# Altium project IR_blaster.PrjPcb
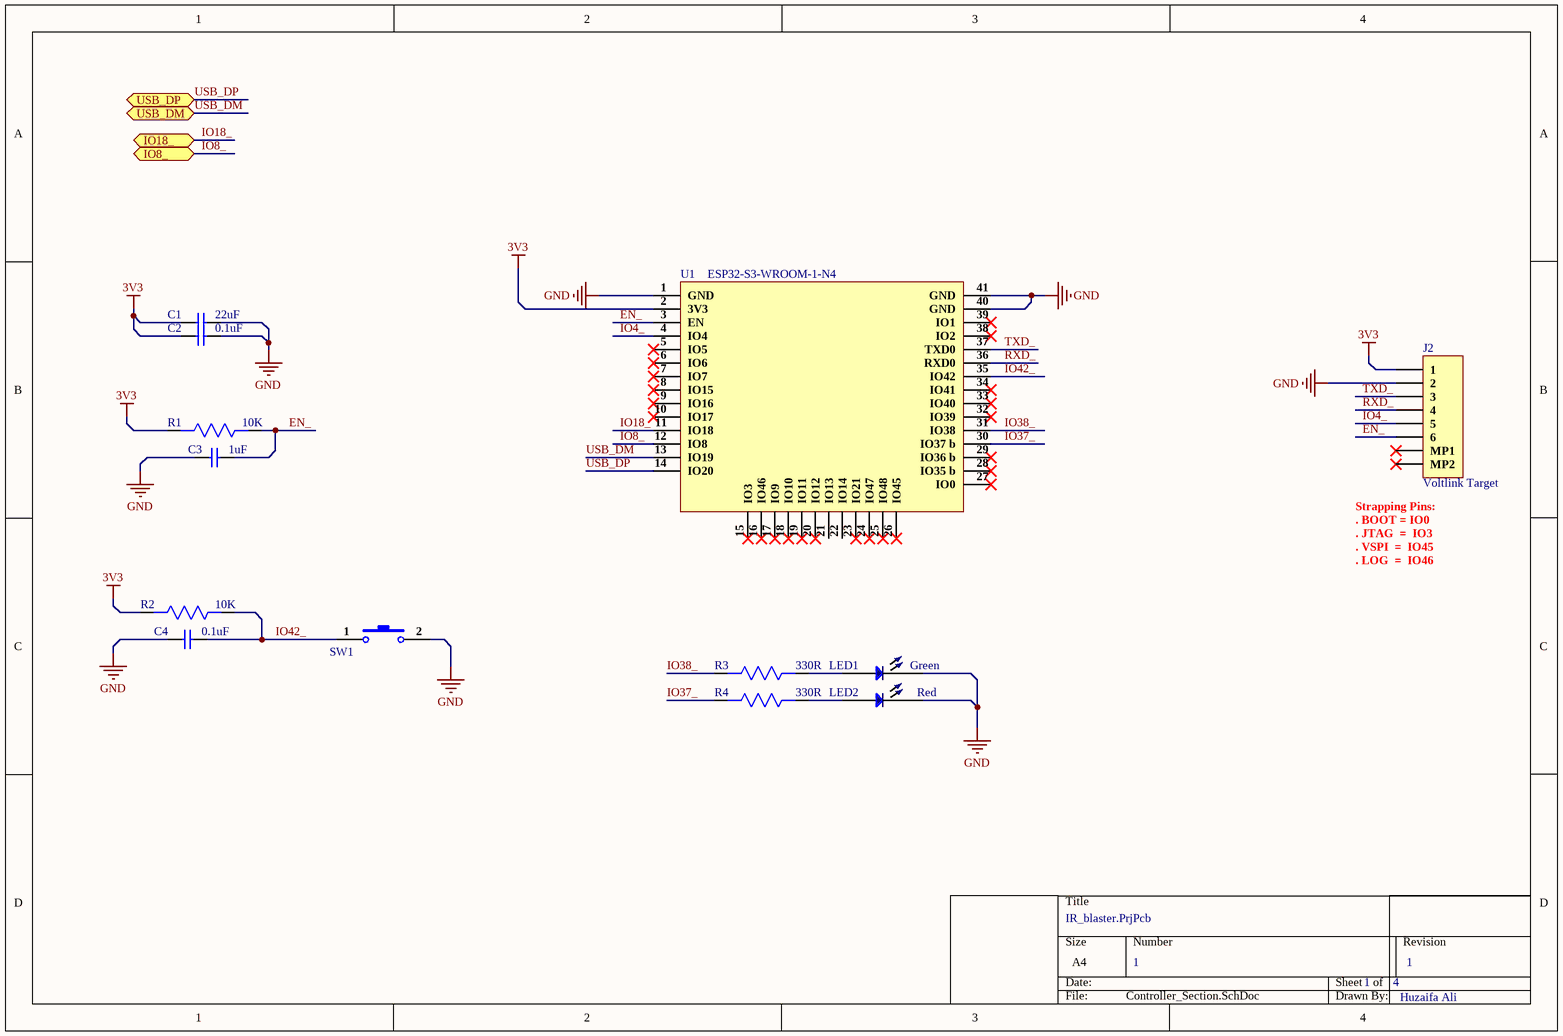
[diagram p0: Controller_Section.SchDoc]
4 sheets, 49 parts. Net scope: flat (ports and power ports of the same name join across sheets).
Board file: iR-Blaster.PcbDoc
Sheets:
  Controller_Section.SchDoc
  iR-Blaster_Section.SchDoc
  iR_Receiver_Section.SchDoc
  USB & LDO_Section.SchDoc

## Sheet Controller_Section.SchDoc: =Projectname
size A4; SheetNumber: 1; SheetTotal: 4

### Parts
C1  22uF  [Cap-0805]
C2  0.1uF  [Cap-0402]
C3  1uF  [Cap-0603]
C4  0.1uF  [Cap-0402]
J2  Voltlink Target  [Voltlink Target]
LED1  Green  [LED-0402]
LED2  Red  [LED-0402]
R1  10K  [RES-0603]
R2  10K  [RES-0603]
R3  330R  [Res-0603]
R4  330R  [Res-0603]
SW1  YTS-B003-2A  [YTS-B003-2A]  (value not drawn)
U1  ESP32-S3-WROOM-1-N4  [41-SMD Module]

### Ports
IO8_ (bidir), IO18_ (bidir), USB_DM (bidir), USB_DP (bidir)

### Nets
3V3: C1.1 C2.1 J2.1 R1.2 R2.2 U1.2(3V3)
GND: C1.2 C2.2 C3.1 C4.1 J2.2 LED1.2 LED2.2 SW1.2 U1.1(GND) U1.40(GND) U1.41(GND)
EN_: C3.2 J2.6 R1.1 U1.3(EN)
IO4_: J2.5 U1.4(IO4)
IO8_: U1.12(IO8) ; port IO8_
IO18_: U1.11(IO18) ; port IO18_
IO37_: R4.2 U1.30(IO37_b)
IO38_: R3.2 U1.31(IO38)
IO42_: C4.2 R2.1 SW1.1 U1.35(IO42)
RXD_: J2.4 U1.36(RXD0)
TXD_: J2.3 U1.37(TXD0)
USB_DM: U1.13(IO19) ; port USB_DM
USB_DP: U1.14(IO20) ; port USB_DP
NetLED1_1: LED1.1 R3.1
NetLED2_1: LED2.1 R4.1

Not connected (* = marked no-connect by the designer): J2 MP1* MP2*; U1 5(IO5)* 6(IO6)* 7(IO7)* 8(IO15)* 9(IO16)* 10(IO17)* 15(IO3)* 16(IO46)* 17(IO9)* 18(IO10)* 19(IO11)* 20(IO12)* 21(IO13) 22(IO14) 23(IO21)* 24(IO47)* 25(IO48)* 26(IO45)* 27(IO0)* 28(IO35_b)* 29(IO36_b)* 32(IO39)* 33(IO40)* 34(IO41)* 38(IO2)* 39(IO1)*

### Notes on the sheet
- (near J2) Strapping Pins:
  . BOOT = IO0
  . JTAG  =  IO3
  . VSPI  =  IO45
  . LOG  =  IO46
- 1
- Huzaifa Ali

### Library data of the parts
C1 = CL21A226MAYNNNE: CAP CER 22UF 25V X5R 0805; Manufacturer: Samsung; Supplier 1: Mouser; Manufacturer Part Number: CL21A226MAYNNNE; RoHS: Yes; Category: Ceramic Capacitors; Stock 1: 1240410; Pricing 1: 1=0.28000, 10=0.18500, 50=0.18500, 100=0.10600, 500=0.07500, 1000=0.06400, 2000=0.06100, 10000=0.05400, 24000=0.05100, 50000=0.04600 (USD); RoHS Compliant: Yes; Supplier Part Number 1: 187-CL21A226MAYNNNE; LCSC Part Number: C602037
C2 C4 = C1005X5R1H104K050BB: CAP CER 0.1UF 50V X5R 0402; Manufacturer: TDK; Dielectric Material: Ceramic; Capacitance: 100nF; Tolerance: 10%; Supplier 1: Digi-Key; Manufacturer Part Number: C1005X5R1H104K050BB; Stock 1: 1455182; Pricing 1: 1=0.12, 10=0.09, 50=0.049, 100=0.04, 500=0.02858, 1000=0.02245, 2500=0.02041, 5000=0.01878 (USD); Mount: Surface Mount; Case/Package: 0402; Case Code (Metric): 1005; Case Code (Imperial): 0402; Weight: 2.3E-05oz; Min Operating Temperature: -55°C; Max Operating Temperature: 85°C; Dielectric: X5R; Voltage Rating: 50V; Packaging: Tape and Reel; Voltage Rating (DC): 50V; Termination: SMD/SMT; Construction: Flat; Package Quantity: 1; Resistor Type: Ceramic; Voltage: 50V; Series: C; Length: 1mm; Width: 0.02inch; Height: 0.5mm; Depth: 0.5mm; Thickness: 0.022inch; Radiation Hardening: No; Lead Free: Lead Free; REACH SVHC: No SVHC; RoHS Compliant: Yes; ComponentLink1URL: https://product.tdk.com/info/en/catalog/spec/mlccspec_commercial_general_midvoltage_en.pdf?src-supplier=Digi-Key; ComponentLink1Description: https://product.tdk.com/info/en/catalog/spec/mlccspec_commercial_general_midvoltage_en.pdf?src-supplier=Digi-Key; ComponentLink2URL: http://www.tdk.co.jp/tefe02/e413_c.pdf?src-supplier=Future+Electronics; ComponentLink2Description: http://www.tdk.co.jp/tefe02/e413_c.pdf?src-supplier=Future+Electronics; ComponentLink3URL: https://www.verical.com/server-webapp/html/getDatasheet?partID=743571&src-supplier=Verical; ComponentLink3Description: https://www.verical.com/server-webapp/html/getDatasheet?partID=743571&src-supplier=Verical; ComponentLink4URL: http://www.tdk.co.jp/tefe02/e412_c.pdf?src-supplier=Avnet+Europe; ComponentLink4Description: http://www.tdk.co.jp/tefe02/e412_c.pdf?src-supplier=Avnet+Europe; Supplier Part Number 1: 445-5942-1-ND; LCSC Part Number: C2181865
C3 = CC0603KRX5R8BB105: CAP CER 1UF 25V X5R 0603; Manufacturer: Yageo; Tolerance: 10%; Supplier 1: Digi-Key; Manufacturer Part Number: CC0603KRX5R8BB105; RoHS: Yes; Category: Ceramic Capacitors; Stock 1: 919939; Pricing 1: 1=0.12000, 10=0.08400, 50=0.04760, 100=0.03940, 500=0.02764, 1000=0.02288 (USD); Mount: Surface Mount; Case/Package: 0603; Number of Pins: 2; Case Code (Metric): 1608; Case Code (Imperial): 0603; Min Operating Temperature: -55°C; Max Operating Temperature: 85°C; Capacitance: 1uF; Dielectric: X5R; Package Quantity: 1; Voltage Rating: 25V; Packaging: Tape and Reel; Termination: SMD/SMT; Voltage Rating (DC): 25V; Series: CC; Construction: Flat; Length: 1.6mm; Width: 0.031inch; Height: 0.8mm; Thickness: 0.035inch; Depth: 0.8mm; Radiation Hardening: No; REACH SVHC: No SVHC; Lead Free: Lead Free; Halogen Free: Halogen Free; RoHS Compliant: Yes; ComponentLink1URL: https://datasheet.ciiva.com/176/mlccorderingcode-176785.pdf?src-supplier=Digi-Key; ComponentLink1Description: https://datasheet.ciiva.com/176/mlccorderingcode-176785.pdf?src-supplier=Digi-Key; ComponentLink2URL: https://datasheet.ciiva.com/176/mlccorderingcode-176786.pdf?src-supplier=Digi-Key; ComponentLink2Description: https://datasheet.ciiva.com/176/mlccorderingcode-176786.pdf?src-supplier=Digi-Key; ComponentLink3URL: https://datasheet.ciiva.com/176/mlccorderingcode-176787.pdf?src-supplier=Digi-Key; ComponentLink3Description: https://datasheet.ciiva.com/176/mlccorderingcode-176787.pdf?src-supplier=Digi-Key; ComponentLink4URL: https://datasheet.ciiva.com/17436/upy-gphc-x5r-4v-to-50v-12-17436952.pdf?src-supplier=Avnet+Europe; ComponentLink4Description: https://datasheet.ciiva.com/17436/upy-gphc-x5r-4v-to-50v-12-17436952.pdf?src-supplier=Avnet+Europe; ComponentLink5URL: https://datasheet.ciiva.com/7978/1525783-7978171.pdf?src-supplier=Element14; ComponentLink5Description: https://datasheet.ciiva.com/7978/1525783-7978171.pdf?src-supplier=Element14; ComponentLink6URL: https://datasheet.ciiva.com/11586/upy-gphc-x5r-4v-to-50v-12-11586318.pdf?src-supplier=Avnet; ComponentLink6Description: https://datasheet.ciiva.com/11586/upy-gphc-x5r-4v-to-50v-12-11586318.pdf?src-supplier=Avnet; Supplier Part Number 1: 311-1445-1-ND; LCSC Part Number: C14664
J2 = Voltlink Target: DNP
LED1 = 16-213/GHC-YR1S1/3T: Green 520~535nm 0402 Light Emitting Diodes (LED) RoHS; Manufacturer: Everlight Elec; Luminous Intensity (IF=20mA): 112~285mcd; Package: 0402; Illumination Color: Green; Dominant Wavelength / Coordinate rank: 520~535nm; Mounting Type: Surface Mount; Manufacturer Part Number: 16-213/GHC-YR1S1/3T; ComponentLink1Description: LCSC; ComponentLink1URL: https://www.lcsc.com/product-detail/Light-Emitting-Diodes-LED_Everlight-Elec-16-213-GHC-YR1S1-3T_C74338.html; LCSC Part Number: C74338; Item Type: LED
LED2 = XZMDK68W-2: LED RED CLEAR CHIP SMD; Manufacturer: SunLED; Lens Color: Colorless; Luminous Intensity: 69mcd; Test Current: 20mA; Viewing Angle: 120°; Dominant Wavelength: 630nm; Forward Voltage: 1.95V; Supplier 1: Digi-Key; Manufacturer Part Number: XZMDK68W-2; Stock 1: 69539; Pricing 1: 1=0.43, 10=0.306, 100=0.136, 500=0.0952, 1000=0.0782 (USD); Mount: Surface Mount; Case/Package: 0402; Color: Red; Case Code (Metric): 1005; Case Code (Imperial): 0402; Packaging: Tape and Reel; Lens Transparency: Clear; Length: 1mm; Height: 0.6mm; Width: 0.5mm; ComponentLink1URL: http://www.sunledusa.com/products/spec/XZMDK68W-2.pdf?src-supplier=Digi-Key; ComponentLink1Description: http://www.sunledusa.com/products/spec/XZMDK68W-2.pdf?src-supplier=Digi-Key; ComponentLink2URL: https://www.sunledusa.com/products/spec/XZMDK68W-2.pdf?src-supplier=Digi-Key; ComponentLink2Description: https://www.sunledusa.com/products/spec/XZMDK68W-2.pdf?src-supplier=Digi-Key; Supplier Part Number 1: 1497-1174-6-ND; Item Type: LED
R1 R2 = CRGH0603J10K: RES SMD 10K OHM 5% 1/5W 0603; Manufacturer: TE Connectivity Holsworthy; Resistance: 10kR; Temperature Coefficient: 100ppm/°C; Power Rating: 200mW; Voltage Rating: 50V; Number of Resistors: 1; ComponentLink1URL: http://www.farnell.com/datasheets/2167052.pdf?src-supplier=Element14; ComponentLink1Description: http://www.farnell.com/datasheets/2167052.pdf?src-supplier=Element14; ComponentLink2URL: https://www.rohm.com/datasheet/ESR01MZPF/esr-e?src-supplier=Digi-Key; ComponentLink2Description: https://www.rohm.com/datasheet/ESR01MZPF/esr-e?src-supplier=Digi-Key; Supplier 1: Digi-Key; Manufacturer Part Number: CRGH0603J10K; Stock 1: 85818; Pricing 1: 1=0.1, 10=0.049, 100=0.02, 1000=0.00899, 2500=0.0078 (USD); Mount: Surface Mount; Case/Package: 0603; Case Code (Imperial): 0603; Case Code (Metric): 1608; Min Operating Temperature: -55°C; Max Operating Temperature: 125°C; Tolerance: 5%; Packaging: Tape and Reel; Resistor Type: Thick Film,Power resistor; Number of Terminations: 2; Series: CRGH; Termination: Solder; Voltage Rating (DC): 50V; Resistance Tolerance: 5%; Technology: THICK FILM; Length: 1.6mm; Width: 0.8mm; Height: 0.45mm; Depth: 0.8mm; RoHS Compliant: Yes; REACH SVHC: No SVHC; ELV: Compliant; ComponentLink3URL: http://www.farnell.com/datasheets/2007183.pdf?src-supplier=Element14; ComponentLink3Description: http://www.farnell.com/datasheets/2007183.pdf?src-supplier=Element14; Supplier Part Number 1: A126394DKR-ND; LCSC Part Number: C2092011
R3 R4 = RC0603JR-07330RL: RES  SMD 330R 100 mW 0603; Manufacturer: Yageo; Power Rating: 100mW; Tolerance: 5%; Voltage Rating (DC): 50V; Temperature Coefficient: 100ppm/°C; Supplier 1: Digi-Key; Manufacturer Part Number: RC0603JR-07330RL; RoHS: Yes; Category: Chip SMD Resistors; Stock 1: 1074593; Pricing 1: 1=0.10000, 10=0.02000, 100=0.00800, 1000=0.00360, 2500=0.00312 (USD); Case/Package: 0603; Number of Pins: 2; Case Code (Imperial): 0603; Case Code (Metric): 1608; Size Code: 0603; Min Operating Temperature: -55°C; Max Operating Temperature: 155°C; Resistance: 330R; Packaging: Tape and Reel; Voltage Rating: 50V; Package Quantity: 5000; Termination: SMD/SMT; Resistor Type: Thick Film; Features: Moisture Resistant; Series: RC; Max Power Dissipation: 100mW; Number of Terminations: 2; Resistance Tolerance: 5%; Construction: Rectangular; Length: 1.6mm; Width: 0.8mm; Height: 0.45mm; Depth: 0.8mm; REACH SVHC: No SVHC; Lead Free: Lead Free; Military Standard: Not; RoHS Compliant: Yes; Supplier Part Number 1: 311-330GRCT-ND; LCSC Part Number: C105879
SW1 = YTS-B003-2A: 3.5mm 3.5mm SMDSplicing Black Rectangle button 50mA Surface Mount 7mm SPST 100MΩ 20000 12V 250gf@±50gf SMD Tactile Switches ROHS; Manufacturer: YIYUAN; Item Type: Switch; Manufacturer Part Number: YTS-B003-2A; Package: Custom; LCSC Part Number: C2910695; ComponentLink1Description: LCSC; ComponentLink1URL: https://lcsc.com/product-detail/Tactile-Switches_YIYUAN-YTS-B003-2A_C2910695.html
U1 = ESP32-S3-WROOM-1-N4: SMD MODULE, ESP32-S3, 4 MB SPI F; Manufacturer: Espressif Systems; Supplier 1: Mouser; Manufacturer Part Number: ESP32-S3-WROOM-1-N4; RoHS: No; Category: Uncategorized; Stock 1: 2246; Pricing 1: 1=3.15000, 10=3.15000, 50=3.15000, 100=3.15000, 1000=3.15000, 10000=3.15000 (USD); Supplier Part Number 1: 356-ESP32-S3WROOM1N4; ComponentLink1Description: LCSC; ComponentLink1URL: https://lcsc.com/product-detail/WiFi-Modules_Espressif-Systems-ESP32-S3-WROOM-1-N4_C2913197.html; LCSC Part Number: C2913197; Item Type: Module

## Sheet iR-Blaster_Section.SchDoc: =Projectname
size A4; SheetNumber: 2; SheetTotal: 4
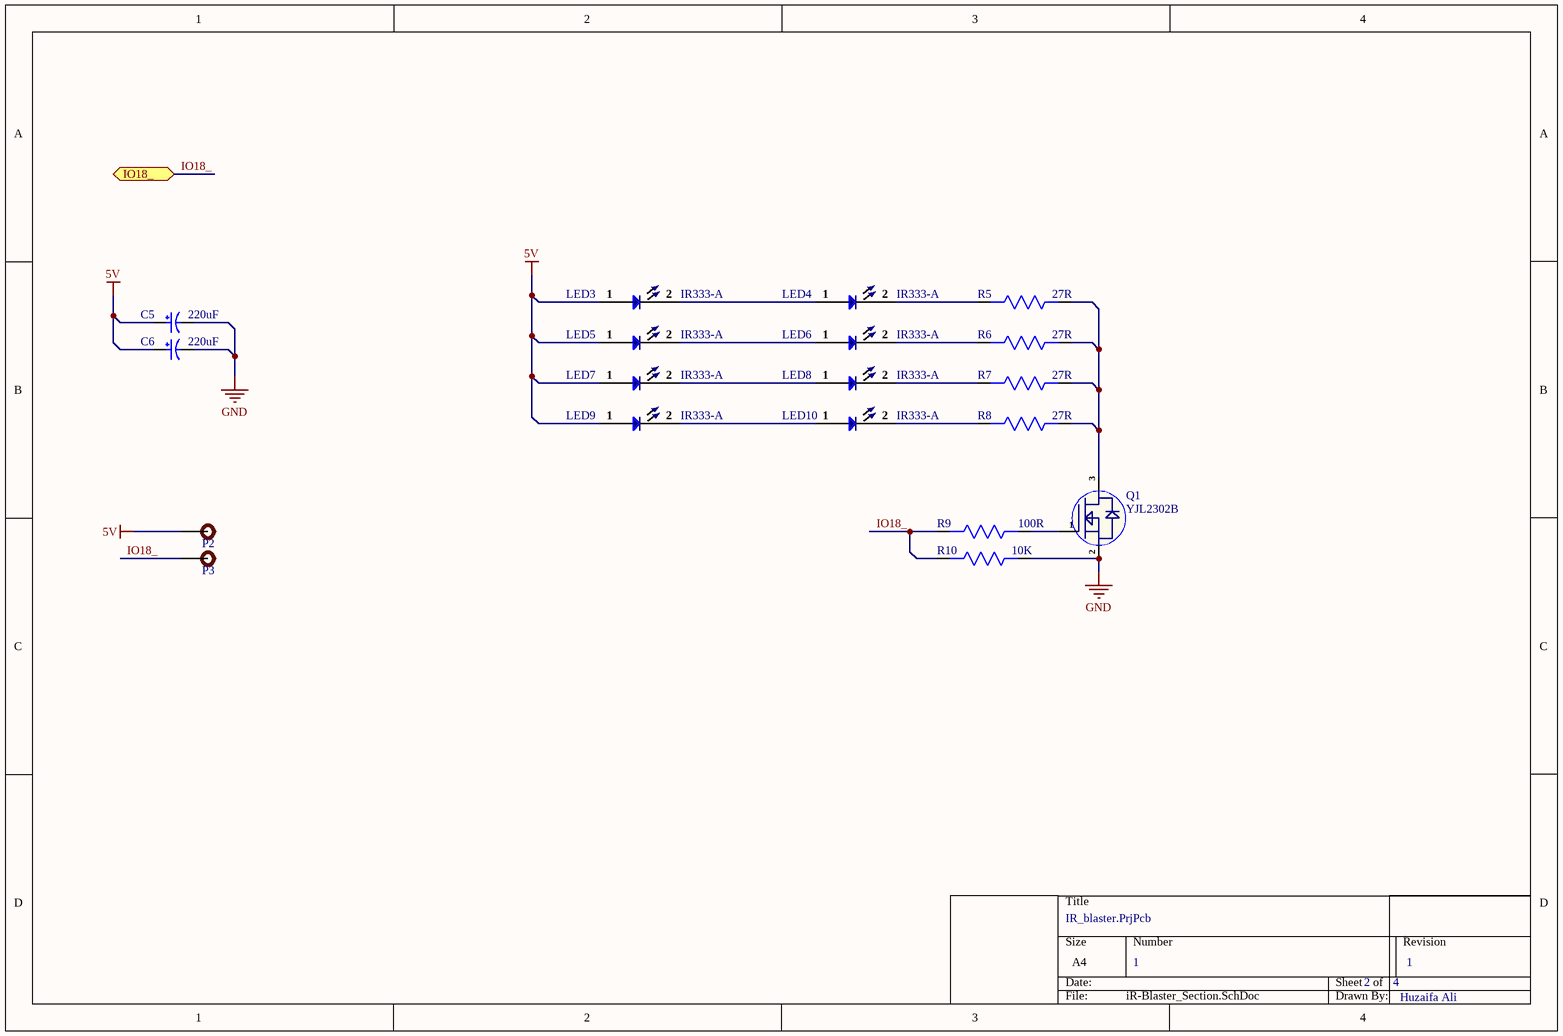
[diagram p1: iR-Blaster_Section.SchDoc]

### Parts
C5  220uF  [RT1A221M0605]
C6  220uF  [RT1A221M0605]
LED3  IR333-A  [IR333_A]
LED4  IR333-A  [IR333_A]
LED5  IR333-A  [IR333_A]
LED6  IR333-A  [IR333_A]
LED7  IR333-A  [IR333_A]
LED8  IR333-A  [IR333_A]
LED9  IR333-A  [IR333_A]
LED10  IR333-A  [IR333_A]
P2  TEST POINT  [Test-point]  (value not drawn)
P3  TEST POINT  [Test-point]  (value not drawn)
Q1  YJL2302B  [SOT-23-3L_]
R5  27R  [Res_1210]
R6  27R  [Res_1210]
R7  27R  [Res_1210]
R8  27R  [Res_1210]
R9  100R  [Res-0603]
R10  10K  [RES-0603]

### Ports
IO18_ (bidir)

### Nets
5V: C5.1 C6.1 LED3.1 LED5.1 LED7.1 LED9.1 P2.1
GND: C5.2 C6.2 Q1.2(S) R10.1
IO18_: P3.1 R9.2 R10.2 ; port IO18_
NetLED3_2: LED3.2 LED4.1
NetLED4_2: LED4.2 R5.2
NetLED5_2: LED5.2 LED6.1
NetLED6_2: LED6.2 R6.2
NetLED7_2: LED7.2 LED8.1
NetLED8_2: LED8.2 R7.2
NetLED9_2: LED9.2 LED10.1
NetLED10_2: LED10.2 R8.2
NetQ1_1: Q1.1(G) R9.1
NetQ1_3: Q1.3(D) R5.1 R6.1 R7.1 R8.1

### Notes on the sheet
- 1
- Huzaifa Ali

### Library data of the parts
C5 C6 = RT1A221M0605: 220uF 5.4mm 10V 6.3mm ±20% SMD,D6.3xL5.4mm Aluminum Electrolytic Capacitors - SMD ROHS; Manufacturer: ROQANG; Manufacturer Part Number: RT1A221M0605; Package: SMD,D6.3xL5.4mm; LCSC Part Number: C267466; Item Type: Capacitor; ComponentLink1Description: LCSC; ComponentLink1URL: https://lcsc.com/product-detail/Aluminum-Electrolytic-Capacitors-SMD_ROQANG-RT1A221M0605_C267466.html
LED3-LED10 = IR333-A: EMITTER IR 940NM 100MA RADIAL; Manufacturer: Everlight; Forward Current: 50mA; Forward Voltage: 1.2V; Viewing Angle: 20°; Lens Style: Diffused,Colored,Circular; Number of LEDs: 1; Test Current: 20mA; Power Dissipation: 100mW; Reverse Voltage: 5V; Item Type: Infrared LED; Supplier 1: Digi-Key; Manufacturer Part Number: IR333-A; RoHS: Yes; Category: LEDs; Stock 1: 73854; Pricing 1: 1=0.54000, 10=0.33000, 100=0.18950, 1000=0.14832, 2000=0.13596, 5000=0.12360, 10000=0.11536, 25000=0.11124 (USD); Mount: Through Hole; Case/Package: Radial; Number of Pins: 2; Min Operating Temperature: -40°C; Max Operating Temperature: 85°C; Packaging: Bulk; Wavelength: 940nm; Package Quantity: 500; Number of Elements: 1; Orientation: Top View; Series: -; Max Power Dissipation: 100mW; Length: 5.9mm; Depth: 5.9mm; RoHS Compliant: Yes; Lead Free: Lead Free; ComponentLink1URL: https://datasheet.ciiva.com/2107/201407061516067600-2107736.pdf?src-supplier=Digi-Key; ComponentLink1Description: https://datasheet.ciiva.com/2107/201407061516067600-2107736.pdf?src-supplier=Digi-Key; ComponentLink2URL: https://datasheet.ciiva.com/48438/ir333-a-eng-tds-48438869.pdf?src-supplier=Distrelec; ComponentLink2Description: https://datasheet.ciiva.com/48438/ir333-a-eng-tds-48438869.pdf?src-supplier=Distrelec; Supplier Part Number 1: 1080-1080-ND; LCSC Part Number: C95407
P2 P3 = TEST POINT: Test Point ON
Q1 = YJL2302B: 20V 3A 40mΩ@4.5V,3A 700mW 780mV@250uA 29pF@10V N Channel 280pF@10V 2.9nC@4.5V -55℃~+150℃@(Tj) SOT-23-3L MOSFETs ROHS; Manufacturer: Yangzhou Yangjie Elec Tech; Item Type: Mosfet; Manufacturer Part Number: YJL2302B; Package: SOT-23-3L; LCSC Part Number: C699316; ComponentLink1Description: LCSC; ComponentLink1URL: https://lcsc.com/product-detail/MOSFETs_Yangzhou-Yangjie-Elec-Tech-YJL2302B_C699316.html
R5-R8 = FRC1210F27R0TS: 500mW Thick Film Resistors 200V ±100ppm/℃ 27Ω 1210 Chip Resistor - SMD ROHS; Manufacturer: FOJAN; Manufacturer Part Number: FRC1210F27R0TS; Package: 1210; LCSC Part Number: C2960734; Item Type: Resistor; ComponentLink1Description: LCSC; ComponentLink1URL: https://www.lcsc.com/product-detail/Chip-span-style-background-color-ff0-Resistor-span-Surface-Mount_FOJAN-FRC1210F27R0TS_C2960734.html
R9 = RC0603FR-07100RL: RES SMD 100 OHM 1% 1/10W 0603; Manufacturer: Yageo; Temperature Coefficient: 100ppm/°C; Voltage Rating (DC): 50V; Power Rating: 100mW; Supplier 1: Arrow Electronics; Manufacturer Part Number: RC0603FR-07100RL; RoHS: Yes; Category: Chip SMD Resistors; Stock 1: 3800000; Pricing 1: 5000=0.00300, 5000=0.00200, 5000=0.00450, 50000=0.00410, 500000=0.00230, 2500000=0.00140 (USD); Case/Package: 0603; Number of Pins: 2; Case Code (Imperial): 0603; Case Code (Metric): 1608; Size Code: 0603; Min Operating Temperature: -55°C; Max Operating Temperature: 155°C; Resistance: 100R; Tolerance: 1%; Resistor Type: Thick Film; Packaging: Tape and Reel; Voltage Rating: 50V; Termination: SMD/SMT; Features: Moisture Resistant; Series: RC; Max Power Dissipation: 100mW; Number of Terminations: 2; Construction: Rectangular; Resistance Tolerance: 1%; Technology: THICK FILM; Length: 1.6mm; Width: 0.8mm; Height: 0.45mm; Depth: 0.8mm; REACH SVHC: Unknown; Lead Free: Lead Free; RoHS Compliant: Yes; Military Standard: Not; Supplier Part Number 1: RC0603FR-07100RL; LCSC Part Number: C105588
R10 = CRGH0603J10K: as R1 on sheet Controller_Section; ComponentLink1URL: http://www.farnell.com/datasheets/2167052.pdf?src-supplier=Element14; ComponentLink1Description: http://www.farnell.com/datasheets/2167052.pdf?src-supplier=Element14; ComponentLink2URL: https://www.rohm.com/datasheet/ESR01MZPF/esr-e?src-supplier=Digi-Key; ComponentLink2Description: https://www.rohm.com/datasheet/ESR01MZPF/esr-e?src-supplier=Digi-Key; Supplier 1: Digi-Key; Manufacturer Part Number: CRGH0603J10K; Stock 1: 85818; Pricing 1: 1=0.1, 10=0.049, 100=0.02, 1000=0.00899, 2500=0.0078 (USD); Mount: Surface Mount; Case/Package: 0603; Case Code (Imperial): 0603; Case Code (Metric): 1608; Min Operating Temperature: -55°C; Max Operating Temperature: 125°C; Tolerance: 5%; Packaging: Tape and Reel; Resistor Type: Thick Film,Power resistor; Number of Terminations: 2; Series: CRGH; Termination: Solder; Voltage Rating (DC): 50V; Resistance Tolerance: 5%; Technology: THICK FILM; Length: 1.6mm; Width: 0.8mm; Height: 0.45mm; Depth: 0.8mm; RoHS Compliant: Yes; REACH SVHC: No SVHC; ELV: Compliant; ComponentLink3URL: http://www.farnell.com/datasheets/2007183.pdf?src-supplier=Element14; ComponentLink3Description: http://www.farnell.com/datasheets/2007183.pdf?src-supplier=Element14; Supplier Part Number 1: A126394DKR-ND; LCSC Part Number: C2092011

## Sheet iR_Receiver_Section.SchDoc: =Projectname
size A4; SheetNumber: 3; SheetTotal: 4
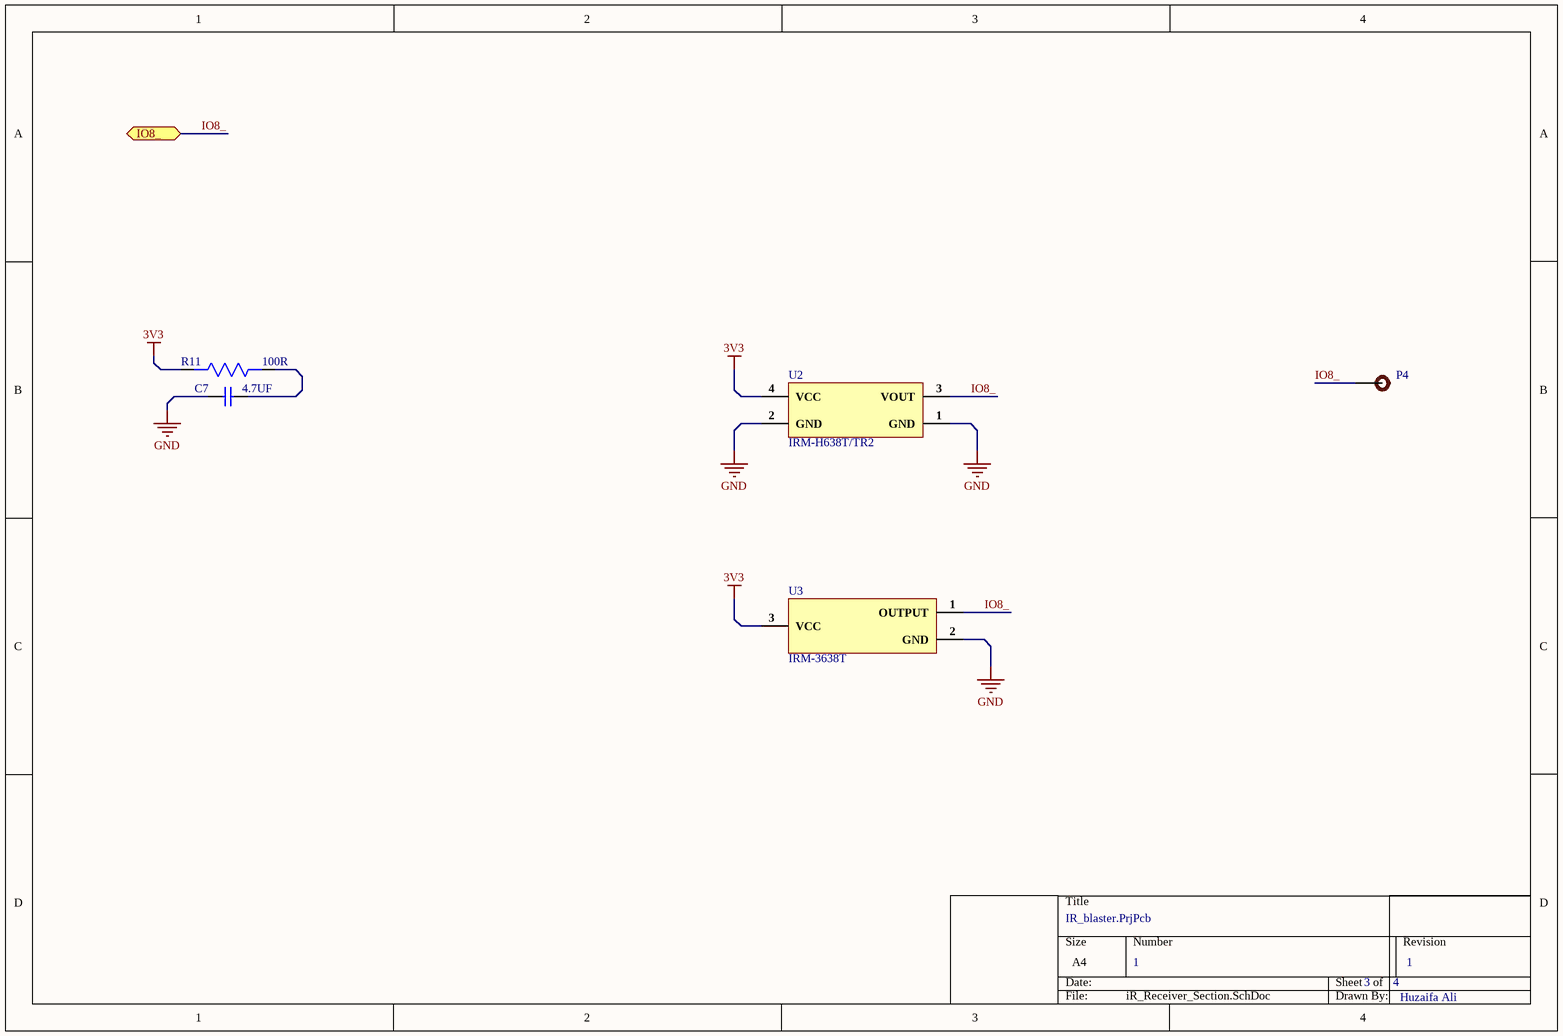
[diagram p2: iR_Receiver_Section.SchDoc]

### Parts
C7  4.7UF  [Cap-0603]
P4  TEST POINT  [Test-point]  (value not drawn)
R11  100R  [Res-0603]
U2  IRM-H638T/TR2  [SMD-4,4x5mm]
U3  IRM-3638T  [SIP-3P-2.54mm]

### Ports
IO8_ (bidir)

### Nets
3V3: R11.2 U2.4(VCC) U3.3(VCC)
GND: C7.1 U2.1(GND) U2.2(GND) U3.2(GND)
IO8_: P4.1 U2.3(VOUT) U3.1(OUTPUT) ; port IO8_
NetC7_2: C7.2 R11.1

### Notes on the sheet
- 1
- Huzaifa Ali

### Library data of the parts
C7 = CL10A475KA8NQNC: CAP CER 4.7UF 25V X5R 0603; Manufacturer: Samsung; Tolerance: 10%; Supplier 1: Digi-Key; Manufacturer Part Number: CL10A475KA8NQNC; Stock 1: 2252340; Pricing 1: 1=0.37, 10=0.255, 100=0.1528, 500=0.11456, 1000=0.09675 (USD); Mount: Surface Mount; Case/Package: 0603; Case Code (Metric): 1608; Case Code (Imperial): 0603; Contact Plating: Tin; Min Operating Temperature: -55°C; Max Operating Temperature: 85°C; Package Quantity: 1; Packaging: Tape and Reel; Capacitance: 4.7uF; Voltage Rating: 25V; Dielectric: X5R; Termination: Wraparound; Length: 1.6mm; Width: 0.031inch; Thickness: 0.035inch; Depth: 0.8mm; Lead Free: Lead Free; ComponentLink1URL: http://www.samsungsem.com/kr/support/product-search/mlcc/CL10A475KA8NQNC.jsp?src-supplier=Digi-Key; ComponentLink1Description: http://www.samsungsem.com/kr/support/product-search/mlcc/CL10A475KA8NQNC.jsp?src-supplier=Digi-Key; Supplier Part Number 1: 1276-1900-1-ND; LCSC Part Number: C69335
P4 = TEST POINT: Test Point ON
R11 = RC0603FR-07100RL: as R9 on sheet iR-Blaster_Section; Supplier 1: Arrow Electronics; Manufacturer Part Number: RC0603FR-07100RL; RoHS: Yes; Category: Chip SMD Resistors; Stock 1: 3800000; Pricing 1: 5000=0.00300, 5000=0.00200, 5000=0.00450, 50000=0.00410, 500000=0.00230, 2500000=0.00140 (USD); Case/Package: 0603; Number of Pins: 2; Case Code (Imperial): 0603; Case Code (Metric): 1608; Size Code: 0603; Min Operating Temperature: -55°C; Max Operating Temperature: 155°C; Resistance: 100R; Tolerance: 1%; Resistor Type: Thick Film; Packaging: Tape and Reel; Voltage Rating: 50V; Termination: SMD/SMT; Features: Moisture Resistant; Series: RC; Max Power Dissipation: 100mW; Number of Terminations: 2; Construction: Rectangular; Resistance Tolerance: 1%; Technology: THICK FILM; Length: 1.6mm; Width: 0.8mm; Height: 0.45mm; Depth: 0.8mm; REACH SVHC: Unknown; Lead Free: Lead Free; RoHS Compliant: Yes; Military Standard: Not; Supplier Part Number 1: RC0603FR-07100RL; LCSC Part Number: C105588
U2 = IRM-H638T/TR2: IRM-H6 Series External Dimensions 5 x 7 x 4 mm SMT Infrared Receiver; Manufacturer: Everlight; Sensing Distance: 8m; Operating Supply Current: 1.2mA; Operating Supply Voltage: 5.5V; Item Type: IC; Supplier 1: Future Electronics; Manufacturer Part Number: IRM-H638T/TR2; RoHS: Yes; Category: Optical Sensors; Pricing 1: 1000=0.53500, 2000=0.52000, 3000=0.51500, 4000=0.51000, 5000=0.49500 (USD); Mount: Surface Mount; Number of Pins: 4; Min Operating Temperature: -25°C; Max Operating Temperature: 85°C; Packaging: Tape and Reel; Package Quantity: 2000; Orientation: Top View; Lead Free: Lead Free; RoHS Compliant: Yes; ComponentLink1URL: https://datasheet.ciiva.com/12418/irm-h638t-tr2-41100-12418542.pdf?src-supplier=Mouser; ComponentLink1Description: https://datasheet.ciiva.com/12418/irm-h638t-tr2-41100-12418542.pdf?src-supplier=Mouser; Supplier Part Number 1: 5043152; LCSC Part Number: C91447
U3 = IRM-3638T: SENSOR REMOTE REC 38.0KHZ 14M; Manufacturer: Everlight; Operating Supply Current: 1mA; Min Output Voltage: 2.7V; Operating Supply Voltage: 5.5V; Item Type: IC; Supplier 1: Future Electronics; Manufacturer Part Number: IRM-3638T; RoHS: Yes; Category: Optical Sensors; Pricing 1: 250=0.20500, 1500=0.19700, 5000=0.19000, 10000=0.18600, 20000=0.18000 (USD); Mount: Through Hole; Case/Package: Module; Number of Pins: 3; Min Operating Temperature: -25°C; Max Operating Temperature: 80°C; Package Quantity: 250; Series: -; Sensing Distance: 14m; Orientation: Side View; RoHS Compliant: Yes; ComponentLink1URL: https://datasheet.ciiva.com/12418/irm-3636t-27149-12418050.pdf?src-supplier=Mouser; ComponentLink1Description: https://datasheet.ciiva.com/12418/irm-3636t-27149-12418050.pdf?src-supplier=Mouser; ComponentLink2URL: https://datasheet.ciiva.com/2821/irm-36xxt-series-2821351.pdf?src-supplier=Digi-Key; ComponentLink2Description: https://datasheet.ciiva.com/2821/irm-36xxt-series-2821351.pdf?src-supplier=Digi-Key; LCSC Part Number: C16216; Supplier Part Number 1: 2052908

## Sheet USB & LDO_Section.SchDoc: =Projectname
size A4; SheetNumber: 4; SheetTotal: 4
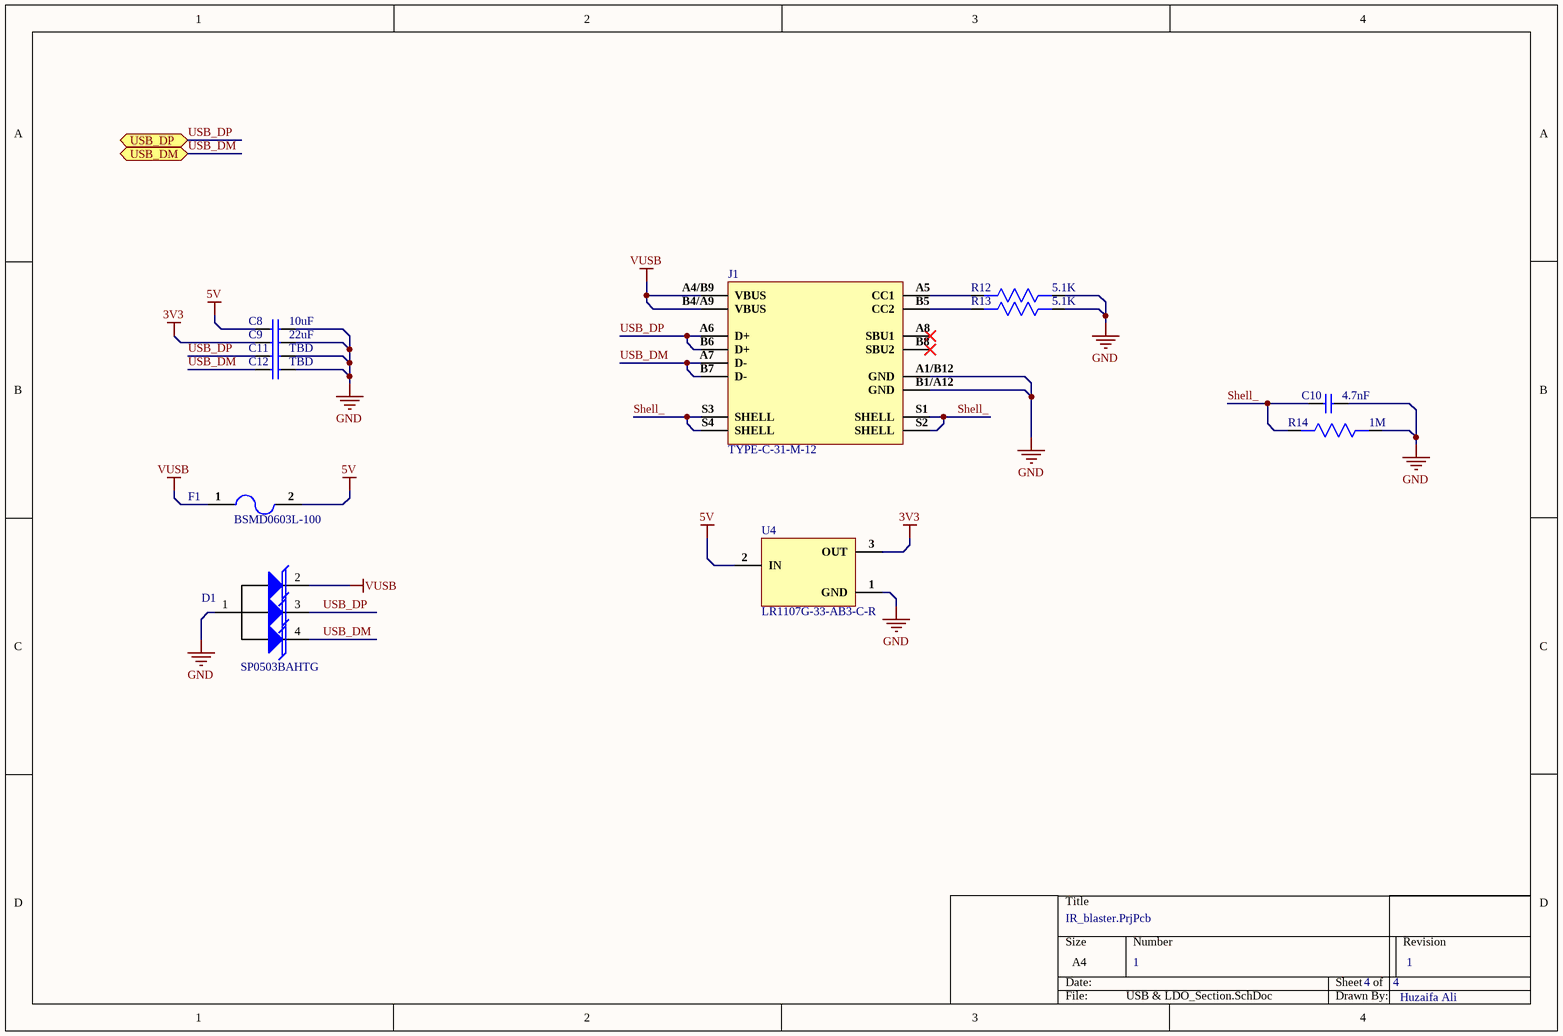
[diagram p3: USB & LDO_Section.SchDoc]

### Parts
C8  10uF  [Cap-0603]
C9  22uF  [Cap-0805]
C10  4.7nF  [Cap-1206]
C11  TBD  [Cap-0402]
C12  TBD  [Cap-0402]
D1  SP0503BAHTG  [SOT-143-4_]
F1  BSMD0603L-100  [fuse-0603]
J1  TYPE-C-31-M-12  [TYPE-C-31-M-12_]
R12  5.1K  [Res-0402]
R13  5.1K  [Res-0402]
R14  1M  [Res-0603]
U4  LR1107G-33-AB3-C-R  [SOT-89-3]

### Ports
USB_DM (bidir), USB_DP (bidir)

### Nets
3V3: C9.1 U4.3(OUT)
5V: C8.1 F1.2 U4.2(IN)
GND: C8.2 C9.2 C10.2 C11.2 C12.2 D1.1(A) J1.A1/B12(GND) J1.B1/A12(GND) R12.1 R13.1 R14.1 U4.1(GND)
VUSB: D1.2(K) F1.1 J1.A4/B9(VBUS) J1.B4/A9(VBUS)
Shell_: C10.1 J1.S1(SHELL) J1.S2(SHELL) J1.S3(SHELL) J1.S4(SHELL) R14.2
USB_DM: C12.1 D1.4(K) J1.A7(D-) J1.B7(D-) ; port USB_DM
USB_DP: C11.1 D1.3(K) J1.A6(D+) J1.B6(D+) ; port USB_DP
NetJ1_A5: J1.A5(CC1) R12.2
NetJ1_B5: J1.B5(CC2) R13.2

Not connected (* = marked no-connect by the designer): J1 A8(SBU1)* B8(SBU2)*

### Notes on the sheet
- 1
- Huzaifa Ali

### Library data of the parts
C8 = C1608X5R1E106M080AC: CAP CER 10UF 25V X5R 0603; Manufacturer: TDK; Dielectric Material: Ceramic; Tolerance: 20%; Supplier 1: Digi-Key; Manufacturer Part Number: C1608X5R1E106M080AC; Stock 1: 61681; Pricing 1: 1=0.96, 10=0.704, 100=0.483, 500=0.38238, 1000=0.322 (USD); Mount: Surface Mount; Case/Package: 0603; Weight: 7.1E-05oz; Case Code (Imperial): 0603; Case Code (Metric): 1608; Min Operating Temperature: -55°C; Max Operating Temperature: 85°C; Capacitance: 10uF; Packaging: Tape and Reel; Voltage Rating: 25V; Voltage Rating (DC): 25V; Termination: SMD/SMT; Package Quantity: 1; Dielectric: X5R; Composition: Ceramic; Length: 1.6mm; Height: 0.8mm; Width: 0.8mm; Thickness: 0.039inch; Depth: 0.8mm; Lead Free: Lead Free; REACH SVHC: No SVHC; Supplier Part Number 1: 445-9015-1-ND; LCSC Part Number: C2168289
C9 = CL21A226MAYNNNE: as C1 on sheet Controller_Section; Supplier 1: Mouser; Manufacturer Part Number: CL21A226MAYNNNE; RoHS: Yes; Category: Ceramic Capacitors; Stock 1: 1240410; Pricing 1: 1=0.28000, 10=0.18500, 50=0.18500, 100=0.10600, 500=0.07500, 1000=0.06400, 2000=0.06100, 10000=0.05400, 24000=0.05100, 50000=0.04600 (USD); RoHS Compliant: Yes; Supplier Part Number 1: 187-CL21A226MAYNNNE; LCSC Part Number: C602037
C10 = CC1206KKX7RCBB472: CAP CER 4700PF 1KV X7R 1206; Manufacturer: Yageo; Dielectric Material: Ceramic; Tolerance: 10%; Item Type: Capacitor; Supplier 1: Future Electronics; Manufacturer Part Number: CC1206KKX7RCBB472; RoHS: Yes; Category: Ceramic Capacitors; Stock 1: 180000; Pricing 1: 3000=0.02860, 9000=0.02750, 15000=0.02700, 45000=0.02600, 75000=0.02510 (USD); Mount: Surface Mount; Case/Package: 1206; Number of Pins: 2; Case Code (Imperial): 1206; Case Code (Metric): 3216; Weight: 0.000571oz; Min Operating Temperature: -55°C; Max Operating Temperature: 125°C; Voltage Rating: 1kV; Capacitance: 4.7nF; Packaging: Tape and Reel; Voltage Rating (DC): 1kV; Dielectric: X7R; Termination: SMD/SMT; Resistor Type: Ceramic; Series: CC; Length: 3.2mm; Width: 0.063inch; Thickness: 0.057inch; Depth: 1.6mm; Radiation Hardening: No; Lead Free: Lead Free; RoHS Compliant: Yes; ComponentLink1URL: https://datasheet.ciiva.com/13208/upy-gp-np0-16v-to-50v-8-13208693.pdf?src-supplier=Mouser; ComponentLink1Description: https://datasheet.ciiva.com/13208/upy-gp-np0-16v-to-50v-8-13208693.pdf?src-supplier=Mouser; ComponentLink2URL: https://datasheet.ciiva.com/11466/hv-11466701.pdf?src-supplier=Avnet; ComponentLink2Description: https://datasheet.ciiva.com/11466/hv-11466701.pdf?src-supplier=Avnet; Supplier Part Number 1: 7130131; LCSC Part Number: C107198
C11 C12 = Capacitor 0402: DO Not Mount
D1 = SP0503BAHTG: ESD Suppressor TVS 5.5V 4-Pin(3+Tab) SOT-143 T/R; Manufacturer: Littelfuse; Element Configuration: Common Anode; Direction: Unidirectional; Capacitance: 30pF; Number of Channels: 3; Clamping Voltage: 7.8V; Power Line Protection: No; Polarity: Bidirectional,Unidirectional; Max Power Dissipation: 225mW; ESD Protection: Yes; Max Reverse Leakage Current: 100nA; Voltage Rating (DC): 5V; Diode Type: Avalanche; Clamping Voltage-Max: 8V; Supplier 1: Digi-Key; Manufacturer Part Number: SP0503BAHTG; RoHS: Yes; Category: Diodes; Stock 1: 651; Pricing 1: 1=0.92000, 10=0.81200, 100=0.62260, 500=0.49214, 1000=0.39371 (USD); Mount: Surface Mount; Case/Package: SOT-143; Number of Pins: 4; Min Operating Temperature: -40°C; Max Operating Temperature: 85°C; Operating Supply Voltage: 5.5V; Packaging: Tape and Reel; Number of Unidirectional Channels: 3; Reverse Standoff Voltage: 5.5V; Breakdown Voltage: 5.5V; Termination: SMD/SMT; Working Voltage: 5.5V; Peak Pulse Power: 225mW; Leakage Current: 100nA; Number of Elements: 3; Power Dissipation: 225mW; Resistor Type: Zener; Series: SP05, SPA®; Length: 3.04mm; Width: 1.4mm; Height: 1.05mm; Depth: 1.4mm; Radiation Hardening: No; REACH SVHC: No SVHC; Lead Free: Lead Free; RoHS Compliant: Yes; ComponentLink1URL: https://datasheet.ciiva.com/15143/getdatasheetpartid-116020-15143550.pdf?src-supplier=Verical; ComponentLink1Description: https://datasheet.ciiva.com/15143/getdatasheetpartid-116020-15143550.pdf?src-supplier=Verical; ComponentLink2URL: https://datasheet.ciiva.com/332/sp05xxba-332550.pdf?src-supplier=Digi-Key; ComponentLink2Description: https://datasheet.ciiva.com/332/sp05xxba-332550.pdf?src-supplier=Digi-Key; ComponentLink3URL: https://datasheet.ciiva.com/8062/littefuse-spa-sp050x-8062422.pdf?src-supplier=Element14; ComponentLink3Description: https://datasheet.ciiva.com/8062/littefuse-spa-sp050x-8062422.pdf?src-supplier=Element14; ComponentLink4URL: https://datasheet.ciiva.com/22697/1911798-22697942.pdf?src-supplier=Element14; ComponentLink4Description: https://datasheet.ciiva.com/22697/1911798-22697942.pdf?src-supplier=Element14; ComponentLink5URL: https://datasheet.ciiva.com/332/sp05xxba-332551.pdf?src-supplier=Digi-Key; ComponentLink5Description: https://datasheet.ciiva.com/332/sp05xxba-332551.pdf?src-supplier=Digi-Key; ComponentLink6URL: https://datasheet.ciiva.com/16449/sp05xxba-16449463.pdf?src-supplier=Future+Electronics; ComponentLink6Description: https://datasheet.ciiva.com/16449/sp05xxba-16449463.pdf?src-supplier=Future+Electronics; ComponentLink7URL: https://datasheet.ciiva.com/332/sp05xxba-332552.pdf?src-supplier=Digi-Key; ComponentLink7Description: https://datasheet.ciiva.com/332/sp05xxba-332552.pdf?src-supplier=Digi-Key; ComponentLink8URL: https://datasheet.ciiva.com/4509/sp05x-leadfree-4509162.pdf?src-supplier=Mouser; ComponentLink8Description: https://datasheet.ciiva.com/4509/sp05x-leadfree-4509162.pdf?src-supplier=Mouser; ComponentLink9URL: https://datasheet.ciiva.com/7650/526672-7650894.pdf?src-supplier=Element14; ComponentLink9Description: https://datasheet.ciiva.com/7650/526672-7650894.pdf?src-supplier=Element14; Supplier Part Number 1: F2715CT-ND; LCSC Part Number: C3029025
F1 = BSMD0603L-100: 6V 1A 50A 1W -40℃~+85℃ 2A 9mΩ 0.5s 80mΩ 0603 Resettable Fuses ROHS; Manufacturer: BHFUSE; Item Type: Fuse; ComponentLink1Description: LCSC; ComponentLink1URL: https://lcsc.com/product-detail/Resettable-Fuses_BHFUSE-BSMD0603L-100_C2757929.html; Manufacturer Part Number: BSMD0603L-100; Package: 0603; LCSC Part Number: C2757929
J1 = TYPE-C-31-M-12: 250mA 1 16 Female Type-C SMD USB Connectors ROHS; Manufacturer: Korean Hroparts Elec; ComponentLink1Description: LCSC; ComponentLink1URL: https://www.lcsc.com/product-detail/USB-Connectors_Korean-Hroparts-Elec-TYPE-C-31-M-12_C165948.html; Manufacturer Part Number: TYPE-C-31-M-12; Footprint: Custom; LCSC Part Number: C165948
R12 R13 = ERJ-PA2F5101X: RES SMD 5.1 KOHM 1% 1/5W 0402; Manufacturer: Panasonic; Supplier 1: Digi-Key; Manufacturer Part Number: ERJ-PA2F5101X; Stock 1: 5235; Pricing 1: 1=0.22, 10=0.183, 100=0.0717, 1000=0.03002, 2500=0.02751, 5000=0.02501 (USD); Supplier Part Number 1: P124488DKR-ND
R14 = RC0603FR-071ML: RES SMD 1M OHM 1% 1/10W 0603; Manufacturer: Yageo; Voltage Rating: 50V; Resistance: 1MR; Power Rating: 100mW; Temperature Coefficient: 100ppm/°C; Supplier 1: Digi-Key; Manufacturer Part Number: RC0603FR-071ML; Stock 1: 3824601; Pricing 1: 1=0.1, 10=0.023, 100=0.0094, 1000=0.00421, 2500=0.00366 (USD); Case/Package: 0603; Number of Pins: 2; Case Code (Imperial): 0603; Case Code (Metric): 1608; Min Operating Temperature: -55°C; Max Operating Temperature: 155°C; Voltage Rating (DC): 50V; Tolerance: 1%; Packaging: Tape and Reel; Package Quantity: 5000; Termination: SMD/SMT; Composition: Thick Film; Military Standard: Not; Length: 1.6mm; Height: 0.45mm; Width: 0.8mm; Depth: 0.8mm; REACH SVHC: No SVHC; Lead Free: Lead Free; ComponentLink1URL: http://www.farnell.com/datasheets/2167052.pdf?src-supplier=Mouser; ComponentLink1Description: http://www.farnell.com/datasheets/2167052.pdf?src-supplier=Mouser; ComponentLink2URL: http://www.farnell.com/datasheets/2167052.pdf?src-supplier=Element14; ComponentLink2Description: http://www.farnell.com/datasheets/2167052.pdf?src-supplier=Element14; ComponentLink3URL: http://documents.rs-components.com/techlib://itc_doclist_GB.htm?stockno=5048956&src-supplier=RSComponents; ComponentLink3Description: http://documents.rs-components.com/techlib://itc_doclist_GB.htm?stockno=5048956&src-supplier=RSComponents; Supplier Part Number 1: 311-1.00MHRDKR-ND; LCSC Part Number: C105578
U4 = LR1107G-33-AB3-C-R: 600mA 60dB 500mV@(600mA) Fixed 3.3V~3.3V Positive 1 7V SOT-89(SOT-89-3) Linear Voltage Regulators (LDO) ROHS; Manufacturer: UTC(Unisonic Tech); Item Type: IC; Manufacturer Part Number: LR1107G-33-AB3-C-R; Package: SOT-89(SOT-89-3); LCSC Part Number: C171498; ComponentLink1Description: LCSC; ComponentLink1URL: https://lcsc.com/product-detail/Linear-Voltage-Regulators-LDO_UTC-Unisonic-Tech-LR1107G-33-AB3-C-R_C171498.html

## Nets that join several sheets
3V3: Controller_Section (6 pins), iR_Receiver_Section (R11.2 U2.4 U3.3), USB & LDO_Section (C9.1 U4.3)
5V: iR-Blaster_Section (7 pins), USB & LDO_Section (C8.1 F1.2 U4.2)
GND: Controller_Section (11 pins), iR-Blaster_Section (C5.2 C6.2 Q1.2 R10.1), iR_Receiver_Section (C7.1 U2.1 U2.2 U3.2), USB & LDO_Section (12 pins)
IO8_: Controller_Section (U1.12), iR_Receiver_Section (P4.1 U2.3 U3.1)
IO18_: Controller_Section (U1.11), iR-Blaster_Section (P3.1 R9.2 R10.2)
USB_DM: Controller_Section (U1.13), USB & LDO_Section (C12.1 D1.4 J1.A7 J1.B7)
USB_DP: Controller_Section (U1.14), USB & LDO_Section (C11.1 D1.3 J1.A6 J1.B6)